# Altium schematic sheet LNA_1_3_GHz.SchDoc
size A; SheetNumber: 3; SheetTotal: 11
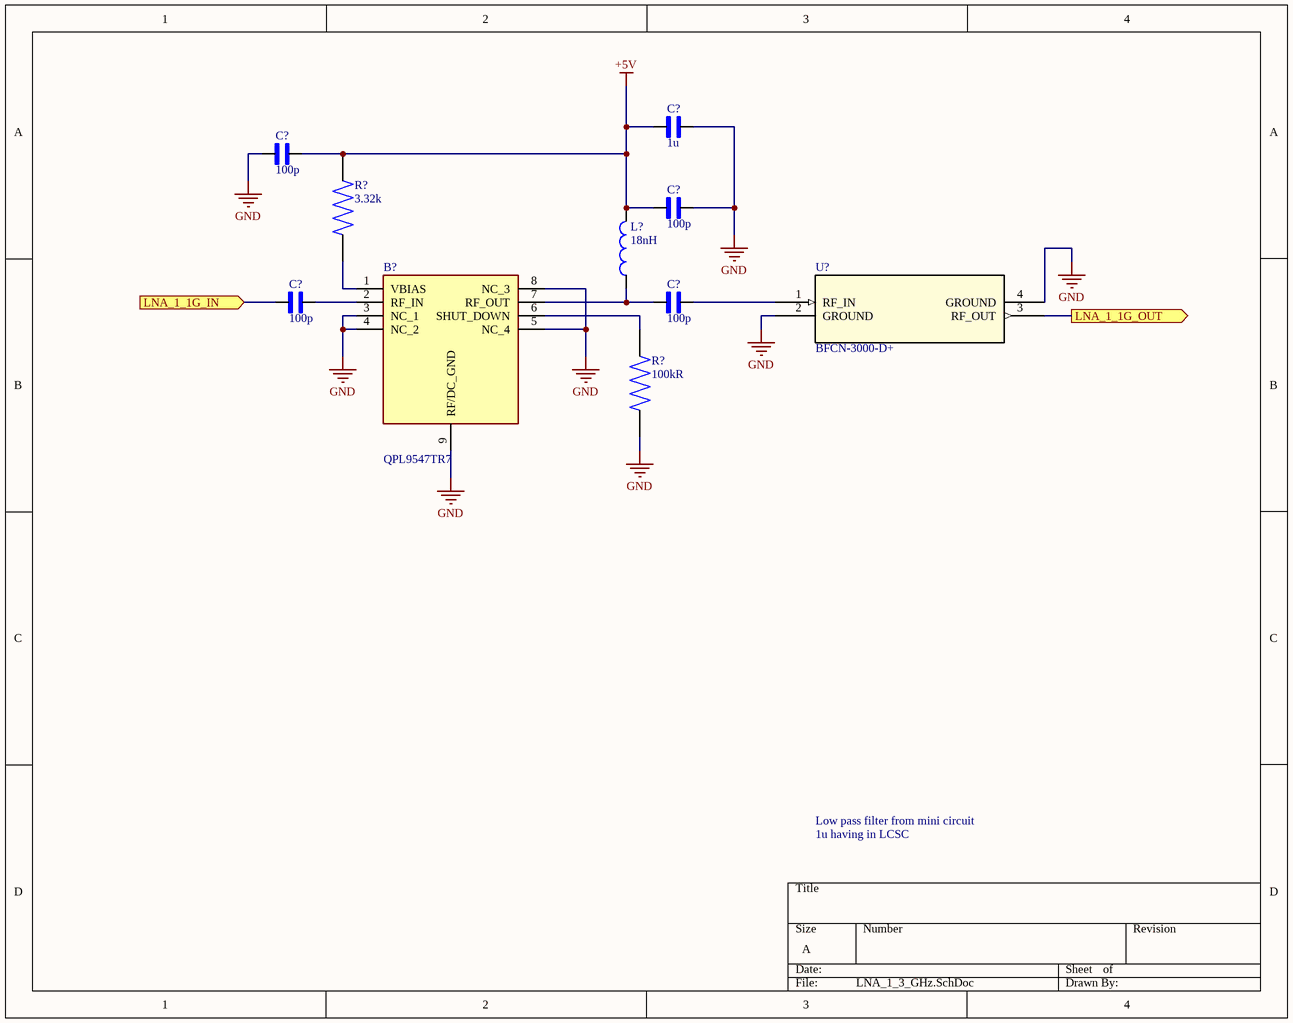
[diagram p0: LNA_1_3_GHz.SchDoc]

## Parts
(Parts that share a designator on the sheet are numbered #1, #2 ... from top to bottom, then left to right.)
B?  QPL9547TR7  [SON50P200X200X90-9N-D]
C?#1  1u  [CAPC1005X60N]
C?#2  100p  [CAPC1005X55N]
C?#3  100p  [CAPC1005X55N]
C?#4  100p  [CAPC1005X55N]
C?#5  100p  [CAPC1005X55N]
L?  18nH  [IND_0402CS-18NXGRW]
R?#1  3.32k  [RESC1005X40N]
R?#2  100kR  [RESC1005X35N]
U?  BFCN-3000-D+  [FV1206_MNC]

## Ports
LNA_1_1G_IN (in), LNA_1_1G_OUT (out)

## Nets
+5V: C?#1.1 C?#2.2 C?#3.1 L?.2 R?#1.2
GND: B?.3(NC_1) B?.4(NC_2) B?.5(NC_4) B?.8(NC_3) B?.9(RF/DC_GND) C?#1.2 C?#2.1 C?#3.2 R?#2.1 U?.2(GROUND) U?.4(GROUND)
LNA_1_1G_IN: C?#4.1 ; port LNA_1_1G_IN
LNA_1_1G_OUT: U?.3(RF_OUT) ; port LNA_1_1G_OUT
NetB?_1: B?.1(VBIAS) R?#1.1
NetB?_2: B?.2(RF_IN) C?#4.2
NetB?_6: B?.6(SHUT_DOWN) R?#2.2
NetB?_7: B?.7(RF_OUT) C?#5.1 L?.1
NetC?#5_2: C?#5.2 U?.1(RF_IN)

## Notes on the sheet
- Low pass filter from mini circuit
- 1u having in LCSC

## Library data of the parts
B? = QPL9547TR7: Ultra Low Noise, Flat Gain LNA; Manufacturer_Name: Qorvo; Geometry.Height: 0.9mm; Manufacturer_Part_Number: QPL9547TR7; Mouser Part Number: 772-QPL9504TR7; Mouser Price/Stock: https://www.mouser.com/en/ProductDetail/Qorvo/QPL9547TR7?qs=7MVldsJ5UaxZMCnAEuCHXA%3D%3D; Arrow Part Number: *; Arrow Price/Stock: *; Datasheet Link: https://www.qorvo.com/products/r/ra006121
C?#1 = GRM155C81E105KE11J-1u: SMD Capacitor X6S(EIA) with Capacitance: 1.0uF Tol. 10%. Rated Voltage: 25Vdc 402; MF: Murata; SnapEDA_Link: https://www.snapeda.com/parts/GRM155C81E105KE11J/Murata/view-part/?ref=snap; Package: 2012 Murata; Value: *; MP: GRM155C81E105KE11J; Check_prices: https://www.snapeda.com/parts/GRM155C81E105KE11J/Murata/view-part/?ref=eda
C?#2-C?#5 = UMK105CG101JV-F-100p: 100 pF Â±5% 50V Ceramic Capacitor C0G, NP0 0402 (1005 Metric); MANUFACTURER: Taiyo Yuden; Package: 1005 Taiyo Yuden; MPN: UMK105CG101JV-F; DATASHEET_URL: https://ds.yuden.co.jp/TYCOMPAS/ut/detail?pn=UMK105CG101JV-F  &u=M; Value: *; SOURCE_URL: https://www.snapeda.com/parts/UMK105CG101JV-F/Taiyo+Yuden/view-part/
L? = 0402CS-18NXGRW: Package: None; Price: None; Value: *; MP: 0402CS-18NXGRW; Availability: Unavailable
R?#1 = ERJ-2RKF3321X-3.32kR: 3.32K OHM 1% 100PPM; Package: None; Price: None; Value: *; MP: ERJ-2RKF3321X; Availability: Unavailable
R?#2 = RNCF0402BKE100K-100kR: MPN: RNCF0402BKE100K; Value: *
U? = BFCN-3000-D+: DC to 3000MHz from mini circuit; Manufacturer_Name: Mini Circuits; Manufacturer_Part_Number: BFCN-1575+; Copyright: Copyright (C) 2026 Ultra Librarian. All rights reserved.; RefDes: RefDes; Type: Type